# Altium schematic sheet IMU_Sheet.SchDoc
size A4; SheetNumber: 5; SheetTotal: 5
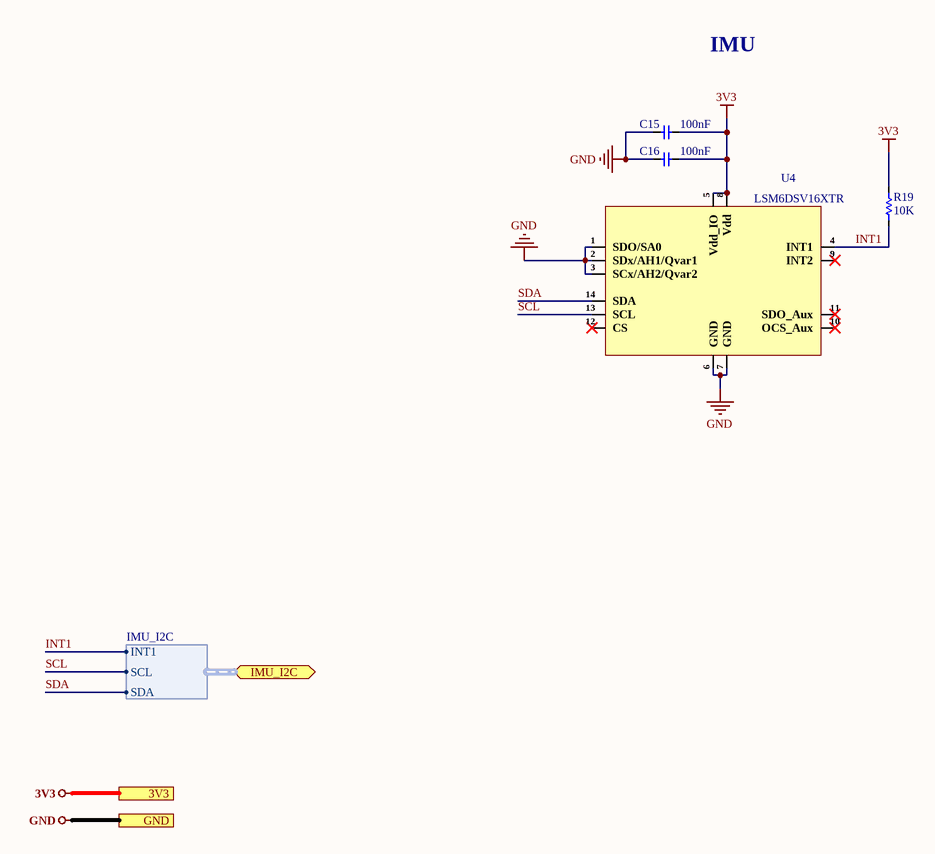
[diagram p0: IMU_Sheet.SchDoc]

## Parts
C15  100nF  [Cap-0402]
C16  100nF  [Cap-0402]
R19  10K  [Res-0402]
U4  LSM6DSV16XTR  [14-LGA (2.5x3)]

## Ports
3V3, GND, IMU_I2C (bidir, harness IMU_I2C)

## Harnesses
IMU_I2C: INT1, SCL, SDA

## Nets
3V3: C15.1 C16.1 R19.1 U4.5(Vdd_IO) U4.8(Vdd) ; port 3V3
GND: C15.2 C16.2 U4.1(SDO/SA0) U4.2(SDx/AH1/Qvar1) U4.3(SCx/AH2/Qvar2) U4.6(GND) U4.7(GND) ; port GND
INT1: R19.2 U4.4(INT1) ; port IMU_I2C.INT1
SCL: U4.13(SCL) ; port IMU_I2C.SCL
SDA: U4.14(SDA) ; port IMU_I2C.SDA

Not connected (* = marked no-connect by the designer): U4 9(INT2)* 10(OCS_Aux)* 11(SDO_Aux)* 12(CS)*

## Notes on the sheet
- IMU
- File:
- Title:
- Date:
- Page
- Num:
- Total:
- Drawn By: Huzaifa Ali

## Library data of the parts
C15 C16 = CC0402KRX5R8BB104: CAP CER 0.1UF 25V X5R 0402; Manufacturer: Yageo; Tolerance: 10%; Item Type: Capacitor; Supplier 1: Digi-Key; Manufacturer Part Number: CC0402KRX5R8BB104; RoHS: Yes; Category: Ceramic Capacitors; Stock 1: 4598218; Pricing 1: 1=0.10000, 10=0.03800, 50=0.02100, 100=0.01710, 500=0.01224, 1000=0.00961, 2500=0.00874, 5000=0.00804 (USD); Mount: Surface Mount; Case/Package: 0402; Case Code (Metric): 1005; Case Code (Imperial): 0402; Min Operating Temperature: -55°C; Max Operating Temperature: 85°C; Voltage Rating: 25V; Packaging: Tape and Reel; Capacitance: 100nF; Voltage Rating (DC): 25V; Dielectric: X5R; Resistor Type: Ceramic; Series: CC; Length: 0.039inch; Width: 0.02inch; Thickness: 0.022inch; Depth: 0.5mm; Lead Free: Lead Free; Halogen Free: Halogen Free; RoHS Compliant: Yes; ComponentLink1URL: http://www.mouser.com/ds/2/447/UPY-GPHC_X5R_4V-to-50V_25-1131599.pdf?src-supplier=Mouser; ComponentLink1Description: http://www.mouser.com/ds/2/447/UPY-GPHC_X5R_4V-to-50V_25-1131599.pdf?src-supplier=Mouser; ComponentLink2URL: http://www.yageo.com/documents/recent/UPY-GPHC_X5R_4V-to-50V-16.pdf?src-supplier=Future+Electronics; ComponentLink2Description: http://www.yageo.com/documents/recent/UPY-GPHC_X5R_4V-to-50V-16.pdf?src-supplier=Future+Electronics; ComponentLink3URL: http://www.yageo.com/documents/recent/UPY-GPHC_X5R_4V-to-50V_25.pdf?src-supplier=Digi-Key; ComponentLink3Description: http://www.yageo.com/documents/recent/UPY-GPHC_X5R_4V-to-50V_25.pdf?src-supplier=Digi-Key; Supplier Part Number 1: 311-1697-1-ND; LCSC Part Number: C106256
R19 = RE0402DRE0710KL: RES SMD 10K OHM 0.5% 1/16W 0402; Manufacturer: Yageo; Value: 10kR; Max Power Dissipation: 63mW; Temperature Coefficient: 50ppm/°C; Item Type: Resistor; Supplier: Future Electronics; Supplier Part Number: 8132697; Manufacturer Part Number: RE0402DRE0710KL; RoHS: Yes; Category: Chip SMD Resistors; Stock: 10000; Pricing: 10000=0.0059, 40000=0.0056, 150000=0.0053, 250000=0.0052, 500000=0.0049 (USD); Case/Package: 0402; Min Operating Temperature: -55°C; Max Operating Temperature: 155°C; Packaging: Tape and Reel; Number of Terminations: 2; Tolerance: 0.5%; Features: Moisture Resistant; Series: RE; Length: 0.039inch; Width: 0.02inch; Height: 0.015inch; RoHS Compliant: Yes; ComponentLink1URL: http://www.yageo.com/NewPortal/yageodocoutput?fileName=/pdf/R-Chip/PYu-RE_105_RoHS_L_6.pdf&src-supplier=Digi-Key; ComponentLink1Description: http://www.yageo.com/NewPortal/yageodocoutput?fileName=/pdf/R-Chip/PYu-RE_105_RoHS_L_6.pdf&src-supplier=Digi-Key; LCSC Part Number: C851874
U4 = LSM6DSV16XTR: INEMO 3D ACCELEROMETER AND 3D GY; Manufacturer: STMicroelectronics; Item Type: IC; Max Supply Voltage: 3.6V; Min Supply Voltage: 1.71V; Supplier: Arrow Electronics; LCSC Part Number: C5267406; Manufacturer Part Number: LSM6DSV16XTR; RoHS: No; Stock: 5000; Pricing: 5000=2.815 (USD); Min Operating Temperature: -40°C; Max Operating Temperature: 85°C; Height: 860um